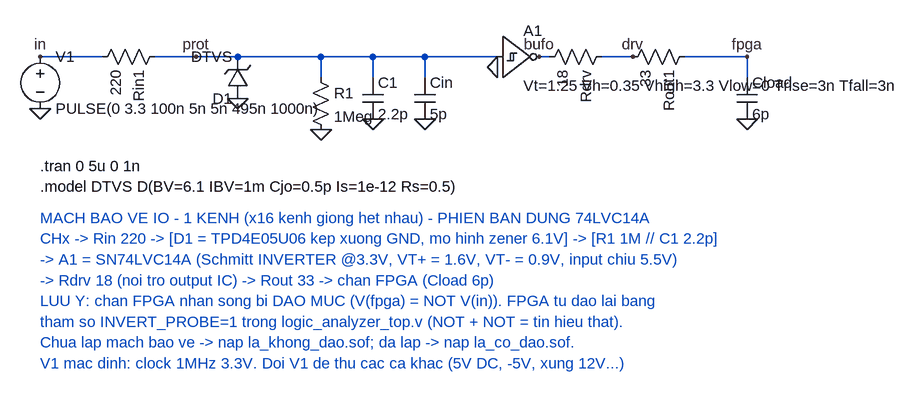
[diagram p0: schematic bao_ve_io_1kenh.asc]
bao_ve_io_1kenh.asc, the LTspice schematic file:
Version 4
SHEET 1 1200 680
WIRE -384 176 -480 176
WIRE -240 176 -304 176
WIRE -176 176 -240 176
WIRE -48 176 -176 176
WIRE 32 176 -48 176
WIRE 112 176 32 176
WIRE 224 176 112 176
WIRE 304 176 288 176
WIRE 432 176 384 176
WIRE 608 176 512 176
WIRE -48 208 -48 176
WIRE 32 208 32 176
WIRE 112 208 112 176
WIRE 608 208 608 176
FLAG -480 256 0
FLAG -480 176 in
FLAG -240 176 prot
FLAG -176 240 0
FLAG -48 288 0
FLAG 32 272 0
FLAG 112 272 0
FLAG 224 192 0
FLAG 288 176 bufo
FLAG 432 176 drv
FLAG 608 176 fpga
FLAG 608 272 0
SYMBOL voltage -480 160 R0
SYMATTR InstName V1
SYMATTR Value PULSE(0 3.3 100n 5n 5n 495n 1000n)
SYMBOL res -288 160 R90
SYMATTR InstName Rin1
SYMATTR Value 220
SYMBOL zener -160 240 R180
SYMATTR InstName D1
SYMATTR Value DTVS
SYMBOL res -64 192 R0
SYMATTR InstName R1
SYMATTR Value 1Meg
SYMBOL cap 16 208 R0
SYMATTR InstName C1
SYMATTR Value 2.2p
SYMBOL cap 96 208 R0
SYMATTR InstName Cin
SYMATTR Value 5p
SYMBOL Digital\\schmtinv 224 112 R0
SYMATTR InstName A1
SYMATTR Value Vt=1.25 Vh=0.35 Vhigh=3.3 Vlow=0 Trise=3n Tfall=3n
SYMBOL res 400 160 R90
SYMATTR InstName Rdrv
SYMATTR Value 18
SYMBOL res 528 160 R90
SYMATTR InstName Rout1
SYMATTR Value 33
SYMBOL cap 592 208 R0
SYMATTR InstName Cload
SYMATTR Value 6p
TEXT -480 344 Left 2 !.tran 0 5u 0 1n
TEXT -480 376 Left 2 !.model DTVS D(BV=6.1 IBV=1m Cjo=0.5p Is=1e-12 Rs=0.5)
TEXT -480 424 Left 2 ;MACH BAO VE IO - 1 KENH (x16 kenh giong het nhau) - PHIEN BAN DUNG 74LVC14A
TEXT -480 456 Left 2 ;CHx -> Rin 220 -> [D1 = TPD4E05U06 kep xuong GND, mo hinh zener 6.1V] -> [R1 1M // C1 2.2p]
TEXT -480 488 Left 2 ;-> A1 = SN74LVC14A (Schmitt INVERTER @3.3V, VT+ = 1.6V, VT- = 0.9V, input chiu 5.5V)
TEXT -480 520 Left 2 ;-> Rdrv 18 (noi tro output IC) -> Rout 33 -> chan FPGA (Cload 6p)
TEXT -480 552 Left 2 ;LUU Y: chan FPGA nhan song bi DAO MUC (V(fpga) = NOT V(in)). FPGA tu dao lai bang
TEXT -480 584 Left 2 ;tham so INVERT_PROBE=1 trong logic_analyzer_top.v (NOT + NOT = tin hieu that).
TEXT -480 616 Left 2 ;Chua lap mach bao ve -> nap la_khong_dao.sof; da lap -> nap la_co_dao.sof.
TEXT -480 648 Left 2 ;V1 mac dinh: clock 1MHz 3.3V. Doi V1 de thu cac ca khac (5V DC, -5V, xung 12V...)

The netlist it stands for:
* bao_ve_io_1kenh.asc
V1 in 0 PULSE(0 3.3 100n 5n 5n 495n 1000n)
Rin1 prot in 220
D1 0 prot DTVS
R1 prot 0 1Meg
C1 prot 0 2.2p
Cin prot 0 5p
A1 prot 0 0 0 0 bufo 0 0 SCHMITT Vt=1.25 Vh=0.35 Vhigh=3.3 Vlow=0 Trise=3n Tfall=3n
Rdrv drv bufo 18
Rout1 fpga drv 33
Cload fpga 0 6p
.model D D
.lib standard.dio
.tran 0 5u 0 1n
.model DTVS D(BV=6.1 IBV=1m Cjo=0.5p Is=1e-12 Rs=0.5)
* MACH BAO VE IO - 1 KENH (x16 kenh giong het nhau) - PHIEN BAN DUNG 74LVC14A
* CHx -> Rin 220 -> [D1 = TPD4E05U06 kep xuong GND, mo hinh zener 6.1V] -> [R1 1M // C1 2.2p]
* -> A1 = SN74LVC14A (Schmitt INVERTER @3.3V, VT+ = 1.6V, VT- = 0.9V, input chiu 5.5V)
* -> Rdrv 18 (noi tro output IC) -> Rout 33 -> chan FPGA (Cload 6p)
* LUU Y: chan FPGA nhan song bi DAO MUC (V(fpga) = NOT V(in)). FPGA tu dao lai bang
* tham so INVERT_PROBE=1 trong logic_analyzer_top.v (NOT + NOT = tin hieu that).
* Chua lap mach bao ve -> nap la_khong_dao.sof; da lap -> nap la_co_dao.sof.
* V1 mac dinh: clock 1MHz 3.3V. Doi V1 de thu cac ca khac (5V DC, -5V, xung 12V...)
.backanno
.end